# Altium schematic sheet Top_Sheet.SchDoc
size A4; SheetNumber: 1; SheetTotal: 20
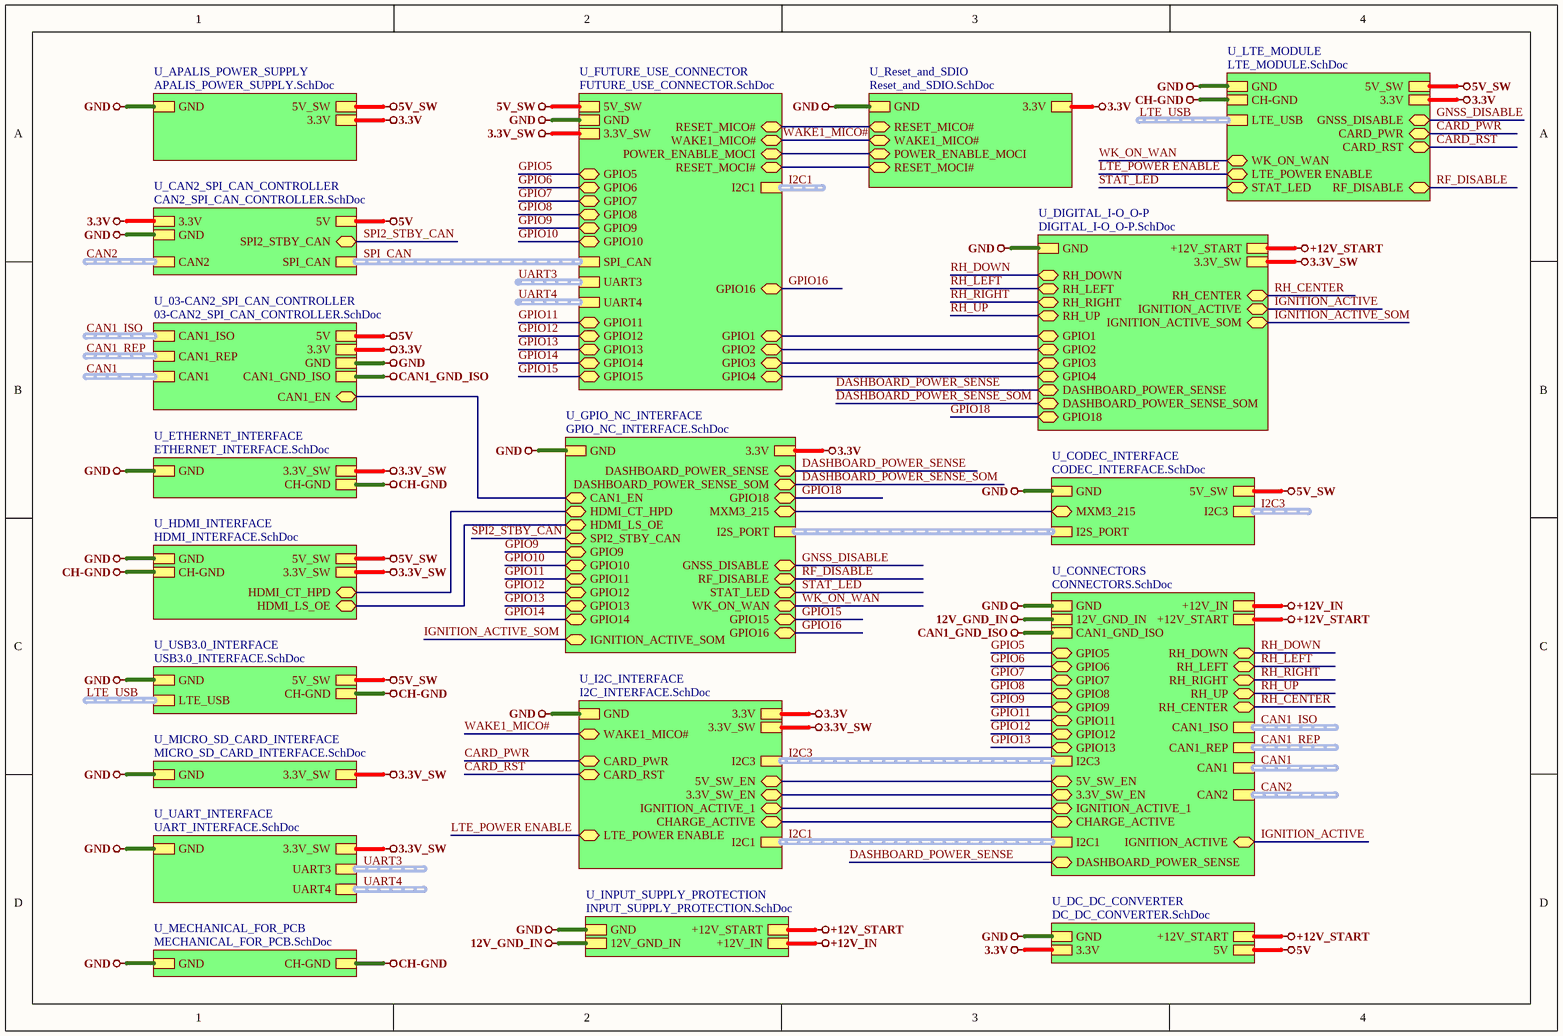
[diagram p0: Top_Sheet.SchDoc]

## Sub-sheets
U_03-CAN2_SPI_CAN_CONTROLLER = 03-CAN2_SPI_CAN_CONTROLLER.SchDoc: CAN1_ISO (harness CAN1_ISO), CAN1_REP (harness CAN1_REP), CAN1 (harness CAN1), 5V, 3.3V, GND, CAN1_GND_ISO, CAN1_EN (bidir)
U_APALIS_POWER_SUPPLY = APALIS_POWER_SUPPLY.SchDoc: 5V_SW, 3.3V, GND
U_CAN2_SPI_CAN_CONTROLLER = CAN2_SPI_CAN_CONTROLLER.SchDoc: SPI_CAN (harness SPI_CAN), 5V, 3.3V, CAN2 (harness CAN2), SPI2_STBY_CAN (bidir), GND
U_CODEC_INTERFACE = CODEC_INTERFACE.SchDoc: I2C3 (harness I2C3), 5V_SW, GND, MXM3_215 (bidir), I2S_PORT (harness I2S_PORT)
U_CONNECTORS = CONNECTORS.SchDoc: CAN1_ISO (harness CAN1_ISO), CAN1_REP (harness CAN1_REP), CAN1 (harness CAN1), CAN1_GND_ISO, GPIO5 (bidir), GPIO6 (bidir), GPIO7 (bidir), GPIO8 (bidir), I2C1 (harness I2C1), GPIO9 (bidir), GPIO11 (bidir), GPIO12 (bidir), GPIO13 (bidir), 5V_SW_EN (bidir), 3.3V_SW_EN (bidir), IGNITION_ACTIVE_1 (bidir), CHARGE_ACTIVE (bidir), +12V_START, IGNITION_ACTIVE (bidir), RH_RIGHT (bidir), RH_CENTER (bidir), RH_UP (bidir), RH_DOWN (bidir), RH_LEFT (bidir), DASHBOARD_POWER_SENSE (bidir), I2C3 (harness I2C3), +12V_IN, CAN2 (harness CAN2), GND, 12V_GND_IN
U_DC_DC_CONVERTER = DC_DC_CONVERTER.SchDoc: +12V_START, GND, 5V, 3.3V
U_DIGITAL_I-O_O-P = DIGITAL_I-O_O-P.SchDoc: RH_UP (bidir), GPIO1 (bidir), RH_DOWN (bidir), RH_LEFT (bidir), GPIO3 (bidir), RH_RIGHT (bidir), DASHBOARD_POWER_SENSE (bidir), DASHBOARD_POWER_SENSE_SOM (bidir), RH_CENTER (bidir), GPIO18 (bidir), IGNITION_ACTIVE (bidir), IGNITION_ACTIVE_SOM (bidir), +12V_START, GND, 3.3V_SW, GPIO2 (bidir), GPIO4 (bidir)
U_ETHERNET_INTERFACE = ETHERNET_INTERFACE.SchDoc: GND, CH-GND, 3.3V_SW
U_FUTURE_USE_CONNECTOR = FUTURE_USE_CONNECTOR.SchDoc: 5V_SW, GND, 3.3V_SW, I2C1 (harness I2C1), GPIO9 (bidir), GPIO11 (bidir), GPIO12 (bidir), GPIO13 (bidir), GPIO10 (bidir), GPIO16 (bidir), GPIO15 (bidir), GPIO14 (bidir), UART3 (harness UART3), UART4 (harness UART4), GPIO1 (bidir), GPIO2 (bidir), GPIO3 (bidir), GPIO4 (bidir), GPIO5 (bidir), GPIO6 (bidir), GPIO7 (bidir), GPIO8 (bidir), SPI_CAN (harness SPI_CAN), RESET_MICO# (bidir), WAKE1_MICO# (bidir), POWER_ENABLE_MOCI (bidir), RESET_MOCI# (bidir)
U_GPIO_NC_INTERFACE = GPIO_NC_INTERFACE.SchDoc: SPI2_STBY_CAN (bidir), GND, DASHBOARD_POWER_SENSE (bidir), DASHBOARD_POWER_SENSE_SOM (bidir), CAN1_EN (bidir), HDMI_CT_HPD (bidir), HDMI_LS_OE (bidir), GPIO10 (bidir), GPIO9 (bidir), GPIO18 (bidir), GPIO16 (bidir), GPIO15 (bidir), GPIO14 (bidir), GPIO11 (bidir), GPIO12 (bidir), GPIO13 (bidir), IGNITION_ACTIVE_SOM (bidir), 3.3V, MXM3_215 (bidir), I2S_PORT (harness I2S_PORT), GNSS_DISABLE (bidir), RF_DISABLE (bidir), STAT_LED (bidir), WK_ON_WAN (bidir)
U_HDMI_INTERFACE = HDMI_INTERFACE.SchDoc: 5V_SW, GND, CH-GND, 3.3V_SW, HDMI_CT_HPD (bidir), HDMI_LS_OE (bidir)
U_I2C_INTERFACE = I2C_INTERFACE.SchDoc: GND, 3.3V, 3.3V_SW, 5V_SW_EN (bidir), 3.3V_SW_EN (bidir), I2C3 (harness I2C3), WAKE1_MICO# (bidir), I2C1 (harness I2C1), IGNITION_ACTIVE_1 (bidir), CHARGE_ACTIVE (bidir), LTE_POWER ENABLE (bidir), CARD_PWR (bidir), CARD_RST (bidir)
U_INPUT_SUPPLY_PROTECTION = INPUT_SUPPLY_PROTECTION.SchDoc: +12V_START, GND, +12V_IN, 12V_GND_IN
U_LTE_MODULE = LTE_MODULE.SchDoc: LTE_POWER ENABLE (bidir), 5V_SW, GND, CH-GND, LTE_USB (harness LTE_USB), CARD_PWR (bidir), CARD_RST (bidir), GNSS_DISABLE (bidir), RF_DISABLE (bidir), STAT_LED (bidir), 3.3V, WK_ON_WAN (bidir)
U_MECHANICAL_FOR_PCB = MECHANICAL_FOR_PCB.SchDoc: GND, CH-GND
U_MICRO_SD_CARD_INTERFACE = MICRO_SD_CARD_INTERFACE.SchDoc: GND, 3.3V_SW
U_Reset_and_SDIO = Reset_and_SDIO.SchDoc: GND, 3.3V, RESET_MICO# (bidir), WAKE1_MICO# (bidir), POWER_ENABLE_MOCI (bidir), RESET_MOCI# (bidir)
U_UART_INTERFACE = UART_INTERFACE.SchDoc: GND, 3.3V_SW, UART3 (harness UART3), UART4 (harness UART4)
U_USB3.0_INTERFACE = USB3.0_INTERFACE.SchDoc: 5V_SW, GND, CH-GND, LTE_USB (harness LTE_USB)

## Nets
3.3V: sheet U_APALIS_POWER_SUPPLY/3.3V, sheet U_CAN2_SPI_CAN_CONTROLLER/3.3V, sheet U_03-CAN2_SPI_CAN_CONTROLLER/3.3V, sheet U_Reset_and_SDIO/3.3V, sheet U_I2C_INTERFACE/3.3V, sheet U_GPIO_NC_INTERFACE/3.3V, sheet U_DC_DC_CONVERTER/3.3V, sheet U_LTE_MODULE/3.3V
3.3V_SW: sheet U_ETHERNET_INTERFACE/3.3V_SW, sheet U_HDMI_INTERFACE/3.3V_SW, sheet U_MICRO_SD_CARD_INTERFACE/3.3V_SW, sheet U_UART_INTERFACE/3.3V_SW, sheet U_FUTURE_USE_CONNECTOR/3.3V_SW, sheet U_I2C_INTERFACE/3.3V_SW, sheet U_DIGITAL_I-O_O-P/3.3V_SW
5V: sheet U_CAN2_SPI_CAN_CONTROLLER/5V, sheet U_03-CAN2_SPI_CAN_CONTROLLER/5V, sheet U_DC_DC_CONVERTER/5V
5V_SW: sheet U_APALIS_POWER_SUPPLY/5V_SW, sheet U_HDMI_INTERFACE/5V_SW, sheet U_USB3.0_INTERFACE/5V_SW, sheet U_FUTURE_USE_CONNECTOR/5V_SW, sheet U_LTE_MODULE/5V_SW, sheet U_CODEC_INTERFACE/5V_SW
12V_GND_IN: sheet U_CONNECTORS/12V_GND_IN, sheet U_INPUT_SUPPLY_PROTECTION/12V_GND_IN
+12V_IN: sheet U_CONNECTORS/+12V_IN, sheet U_INPUT_SUPPLY_PROTECTION/+12V_IN
+12V_START: sheet U_DIGITAL_I-O_O-P/+12V_START, sheet U_CONNECTORS/+12V_START, sheet U_INPUT_SUPPLY_PROTECTION/+12V_START, sheet U_DC_DC_CONVERTER/+12V_START
CAN1_GND_ISO: sheet U_03-CAN2_SPI_CAN_CONTROLLER/CAN1_GND_ISO, sheet U_CONNECTORS/CAN1_GND_ISO
CH-GND: sheet U_ETHERNET_INTERFACE/CH-GND, sheet U_HDMI_INTERFACE/CH-GND, sheet U_USB3.0_INTERFACE/CH-GND, sheet U_MECHANICAL_FOR_PCB/CH-GND, sheet U_LTE_MODULE/CH-GND
GND: sheet U_APALIS_POWER_SUPPLY/GND, sheet U_CAN2_SPI_CAN_CONTROLLER/GND, sheet U_03-CAN2_SPI_CAN_CONTROLLER/GND, sheet U_ETHERNET_INTERFACE/GND, sheet U_HDMI_INTERFACE/GND, sheet U_USB3.0_INTERFACE/GND, sheet U_MICRO_SD_CARD_INTERFACE/GND, sheet U_UART_INTERFACE/GND, sheet U_FUTURE_USE_CONNECTOR/GND, sheet U_Reset_and_SDIO/GND, sheet U_I2C_INTERFACE/GND, sheet U_GPIO_NC_INTERFACE/GND, sheet U_DIGITAL_I-O_O-P/GND, sheet U_CONNECTORS/GND, sheet U_INPUT_SUPPLY_PROTECTION/GND, sheet U_DC_DC_CONVERTER/GND, sheet U_MECHANICAL_FOR_PCB/GND, sheet U_LTE_MODULE/GND, sheet U_CODEC_INTERFACE/GND
CARD_PWR: sheet U_I2C_INTERFACE/CARD_PWR, sheet U_LTE_MODULE/CARD_PWR
CARD_RST: sheet U_I2C_INTERFACE/CARD_RST, sheet U_LTE_MODULE/CARD_RST
DASHBOARD_POWER_SENSE: sheet U_GPIO_NC_INTERFACE/DASHBOARD_POWER_SENSE, sheet U_DIGITAL_I-O_O-P/DASHBOARD_POWER_SENSE, sheet U_CONNECTORS/DASHBOARD_POWER_SENSE
DASHBOARD_POWER_SENSE_SOM: sheet U_GPIO_NC_INTERFACE/DASHBOARD_POWER_SENSE_SOM, sheet U_DIGITAL_I-O_O-P/DASHBOARD_POWER_SENSE_SOM
GNSS_DISABLE: sheet U_GPIO_NC_INTERFACE/GNSS_DISABLE, sheet U_LTE_MODULE/GNSS_DISABLE
GPIO5: sheet U_FUTURE_USE_CONNECTOR/GPIO5, sheet U_CONNECTORS/GPIO5
GPIO6: sheet U_FUTURE_USE_CONNECTOR/GPIO6, sheet U_CONNECTORS/GPIO6
GPIO7: sheet U_FUTURE_USE_CONNECTOR/GPIO7, sheet U_CONNECTORS/GPIO7
GPIO8: sheet U_FUTURE_USE_CONNECTOR/GPIO8, sheet U_CONNECTORS/GPIO8
GPIO9: sheet U_FUTURE_USE_CONNECTOR/GPIO9, sheet U_GPIO_NC_INTERFACE/GPIO9, sheet U_CONNECTORS/GPIO9
GPIO10: sheet U_FUTURE_USE_CONNECTOR/GPIO10, sheet U_GPIO_NC_INTERFACE/GPIO10
GPIO11: sheet U_FUTURE_USE_CONNECTOR/GPIO11, sheet U_GPIO_NC_INTERFACE/GPIO11, sheet U_CONNECTORS/GPIO11
GPIO12: sheet U_FUTURE_USE_CONNECTOR/GPIO12, sheet U_GPIO_NC_INTERFACE/GPIO12, sheet U_CONNECTORS/GPIO12
GPIO13: sheet U_FUTURE_USE_CONNECTOR/GPIO13, sheet U_GPIO_NC_INTERFACE/GPIO13, sheet U_CONNECTORS/GPIO13
GPIO14: sheet U_FUTURE_USE_CONNECTOR/GPIO14, sheet U_GPIO_NC_INTERFACE/GPIO14
GPIO15: sheet U_FUTURE_USE_CONNECTOR/GPIO15, sheet U_GPIO_NC_INTERFACE/GPIO15
GPIO16: sheet U_FUTURE_USE_CONNECTOR/GPIO16, sheet U_GPIO_NC_INTERFACE/GPIO16
GPIO18: sheet U_GPIO_NC_INTERFACE/GPIO18, sheet U_DIGITAL_I-O_O-P/GPIO18
IGNITION_ACTIVE: sheet U_DIGITAL_I-O_O-P/IGNITION_ACTIVE, sheet U_CONNECTORS/IGNITION_ACTIVE
IGNITION_ACTIVE_SOM: sheet U_GPIO_NC_INTERFACE/IGNITION_ACTIVE_SOM, sheet U_DIGITAL_I-O_O-P/IGNITION_ACTIVE_SOM
LTE_POWER ENABLE: sheet U_I2C_INTERFACE/LTE_POWER ENABLE, sheet U_LTE_MODULE/LTE_POWER ENABLE
RF_DISABLE: sheet U_GPIO_NC_INTERFACE/RF_DISABLE, sheet U_LTE_MODULE/RF_DISABLE
RH_CENTER: sheet U_DIGITAL_I-O_O-P/RH_CENTER, sheet U_CONNECTORS/RH_CENTER
RH_DOWN: sheet U_DIGITAL_I-O_O-P/RH_DOWN, sheet U_CONNECTORS/RH_DOWN
RH_LEFT: sheet U_DIGITAL_I-O_O-P/RH_LEFT, sheet U_CONNECTORS/RH_LEFT
RH_RIGHT: sheet U_DIGITAL_I-O_O-P/RH_RIGHT, sheet U_CONNECTORS/RH_RIGHT
RH_UP: sheet U_DIGITAL_I-O_O-P/RH_UP, sheet U_CONNECTORS/RH_UP
SPI2_STBY_CAN: sheet U_CAN2_SPI_CAN_CONTROLLER/SPI2_STBY_CAN, sheet U_GPIO_NC_INTERFACE/SPI2_STBY_CAN
STAT_LED: sheet U_GPIO_NC_INTERFACE/STAT_LED, sheet U_LTE_MODULE/STAT_LED
WAKE1_MICO#: sheet U_FUTURE_USE_CONNECTOR/WAKE1_MICO#, sheet U_Reset_and_SDIO/WAKE1_MICO#, sheet U_I2C_INTERFACE/WAKE1_MICO#
WK_ON_WAN: sheet U_GPIO_NC_INTERFACE/WK_ON_WAN, sheet U_LTE_MODULE/WK_ON_WAN
(unnamed): sheet U_03-CAN2_SPI_CAN_CONTROLLER/CAN1_EN, sheet U_GPIO_NC_INTERFACE/CAN1_EN
(unnamed): sheet U_HDMI_INTERFACE/HDMI_CT_HPD, sheet U_GPIO_NC_INTERFACE/HDMI_CT_HPD
(unnamed): sheet U_HDMI_INTERFACE/HDMI_LS_OE, sheet U_GPIO_NC_INTERFACE/HDMI_LS_OE
(unnamed): sheet U_FUTURE_USE_CONNECTOR/GPIO1, sheet U_DIGITAL_I-O_O-P/GPIO1
(unnamed): sheet U_FUTURE_USE_CONNECTOR/GPIO2, sheet U_DIGITAL_I-O_O-P/GPIO2
(unnamed): sheet U_FUTURE_USE_CONNECTOR/GPIO3, sheet U_DIGITAL_I-O_O-P/GPIO3
(unnamed): sheet U_FUTURE_USE_CONNECTOR/GPIO4, sheet U_DIGITAL_I-O_O-P/GPIO4
(unnamed): sheet U_FUTURE_USE_CONNECTOR/RESET_MICO#, sheet U_Reset_and_SDIO/RESET_MICO#
(unnamed): sheet U_FUTURE_USE_CONNECTOR/POWER_ENABLE_MOCI, sheet U_Reset_and_SDIO/POWER_ENABLE_MOCI
(unnamed): sheet U_FUTURE_USE_CONNECTOR/RESET_MOCI#, sheet U_Reset_and_SDIO/RESET_MOCI#
(unnamed): sheet U_I2C_INTERFACE/5V_SW_EN, sheet U_CONNECTORS/5V_SW_EN
(unnamed): sheet U_I2C_INTERFACE/3.3V_SW_EN, sheet U_CONNECTORS/3.3V_SW_EN
(unnamed): sheet U_I2C_INTERFACE/IGNITION_ACTIVE_1, sheet U_CONNECTORS/IGNITION_ACTIVE_1
(unnamed): sheet U_I2C_INTERFACE/CHARGE_ACTIVE, sheet U_CONNECTORS/CHARGE_ACTIVE
(unnamed): sheet U_GPIO_NC_INTERFACE/MXM3_215, sheet U_CODEC_INTERFACE/MXM3_215

## Buses and harness runs
harness CAN1 = sheet U_03-CAN2_SPI_CAN_CONTROLLER/CAN1
harness CAN1 = sheet U_CONNECTORS/CAN1
harness CAN1_ISO = sheet U_03-CAN2_SPI_CAN_CONTROLLER/CAN1_ISO
harness CAN1_ISO = sheet U_CONNECTORS/CAN1_ISO
harness CAN1_REP = sheet U_03-CAN2_SPI_CAN_CONTROLLER/CAN1_REP
harness CAN1_REP = sheet U_CONNECTORS/CAN1_REP
harness CAN2 = sheet U_CAN2_SPI_CAN_CONTROLLER/CAN2
harness CAN2 = sheet U_CONNECTORS/CAN2
harness I2C1 = sheet U_CONNECTORS/I2C1 = sheet U_I2C_INTERFACE/I2C1
harness I2C1 = sheet U_FUTURE_USE_CONNECTOR/I2C1
harness I2C3 = sheet U_CODEC_INTERFACE/I2C3
harness I2C3 = sheet U_CONNECTORS/I2C3 = sheet U_I2C_INTERFACE/I2C3
harness LTE_USB = sheet U_LTE_MODULE/LTE_USB
harness LTE_USB = sheet U_USB3.0_INTERFACE/LTE_USB
harness sheet U_CODEC_INTERFACE/I2S_PORT = sheet U_GPIO_NC_INTERFACE/I2S_PORT
harness SPI_CAN = sheet U_CAN2_SPI_CAN_CONTROLLER/SPI_CAN = sheet U_FUTURE_USE_CONNECTOR/SPI_CAN
harness UART3 = sheet U_FUTURE_USE_CONNECTOR/UART3
harness UART3 = sheet U_UART_INTERFACE/UART3
harness UART4 = sheet U_FUTURE_USE_CONNECTOR/UART4
harness UART4 = sheet U_UART_INTERFACE/UART4